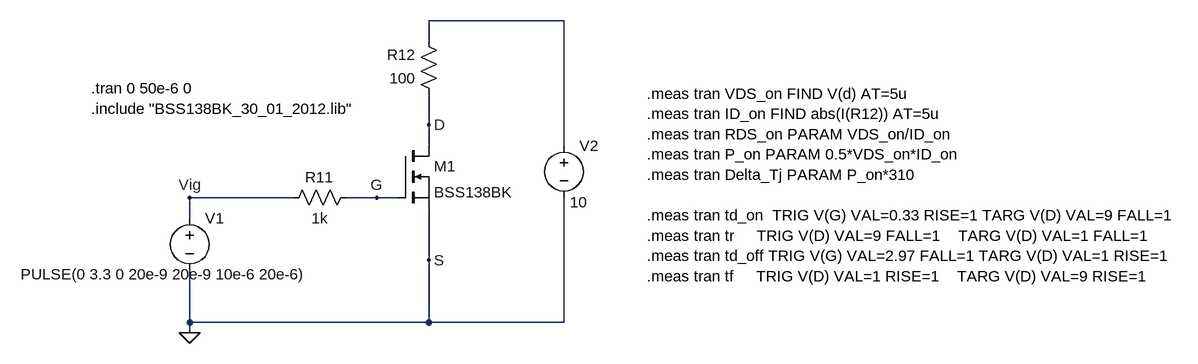
[diagram p0: schematic simulation.asc]
simulation.asc, the LTspice schematic file:
Version 4.1
SHEET 1 1452 680
WIRE 464 -112 256 -112
WIRE 256 -80 256 -112
WIRE 256 48 256 0
WIRE 256 80 256 48
WIRE 464 80 464 -112
WIRE 48 160 -112 160
WIRE 176 160 128 160
WIRE 208 160 176 160
WIRE -112 192 -112 160
WIRE 256 256 256 176
WIRE -112 352 -112 272
WIRE 256 352 256 256
WIRE 256 352 -112 352
WIRE 464 352 464 160
WIRE 464 352 256 352
WIRE -112 368 -112 352
FLAG -112 368 0
FLAG -112 160 Vig
FLAG 176 160 G
FLAG 256 256 S
FLAG 256 48 D
SYMBOL res 144 144 R90
WINDOW 0 0 56 VBottom 2
WINDOW 3 32 56 VTop 2
SYMATTR InstName R11
SYMATTR Value 1k
SYMBOL res 272 16 R180
WINDOW 0 36 76 Left 2
WINDOW 3 36 40 Left 2
SYMATTR InstName R12
SYMATTR Value 100
SYMBOL voltage -112 176 R0
WINDOW 3 -260 102 Left 2
WINDOW 123 0 0 Left 0
WINDOW 39 0 0 Left 0
SYMATTR InstName V1
SYMATTR Value PULSE(0 3.3 0 20e-9 20e-9 10e-6 20e-6)
SYMBOL voltage 464 64 R0
WINDOW 3 9 103 Left 2
WINDOW 123 0 0 Left 0
WINDOW 39 0 0 Left 0
SYMATTR InstName V2
SYMATTR Value 10
SYMBOL nmos 208 80 R0
SYMATTR InstName M1
SYMATTR Value BSS138BK
SYMATTR Prefix x
TEXT -264 -8 Left 2 !.tran 0 50e-6 0\n.include "BSS138BK_30_01_2012.lib"
TEXT 592 0 Left 2 !.meas tran VDS_on FIND V(d) AT=5u\n.meas tran ID_on FIND abs(I(R12)) AT=5u\n.meas tran RDS_on PARAM VDS_on/ID_on\n.meas tran P_on PARAM 0.5*VDS_on*ID_on\n.meas tran Delta_Tj PARAM P_on*310\n \n.meas tran td_on  TRIG V(G) VAL=0.33 RISE=1 TARG V(D) VAL=9 FALL=1\n.meas tran tr     TRIG V(D) VAL=9 FALL=1    TARG V(D) VAL=1 FALL=1\n.meas tran td_off TRIG V(G) VAL=2.97 FALL=1 TARG V(D) VAL=1 RISE=1\n.meas tran tf     TRIG V(D) VAL=1 RISE=1    TARG V(D) VAL=9 RISE=1

The netlist it stands for:
* simulation.asc
R11 G Vig 1k
R12 D N001 100
V1 Vig 0 PULSE(0 3.3 0 20e-9 20e-9 10e-6 20e-6)
V2 N001 0 10
X§M1 D G 0 BSS138BK  ; pins D G S
.tran 0 50e-6 0
.include "BSS138BK_30_01_2012.lib"
.meas tran VDS_on FIND V(d) AT=5u
.meas tran ID_on FIND abs(I(R12)) AT=5u
.meas tran RDS_on PARAM VDS_on/ID_on
.meas tran P_on PARAM 0.5*VDS_on*ID_on
.meas tran Delta_Tj PARAM P_on*310
.meas tran td_on  TRIG V(G) VAL=0.33 RISE=1 TARG V(D) VAL=9 FALL=1
.meas tran tr     TRIG V(D) VAL=9 FALL=1    TARG V(D) VAL=1 FALL=1
.meas tran td_off TRIG V(G) VAL=2.97 FALL=1 TARG V(D) VAL=1 RISE=1
.meas tran tf     TRIG V(D) VAL=1 RISE=1    TARG V(D) VAL=9 RISE=1
.backanno
.end

* Results of the author's LTspice run, read from the files saved beside the schematic
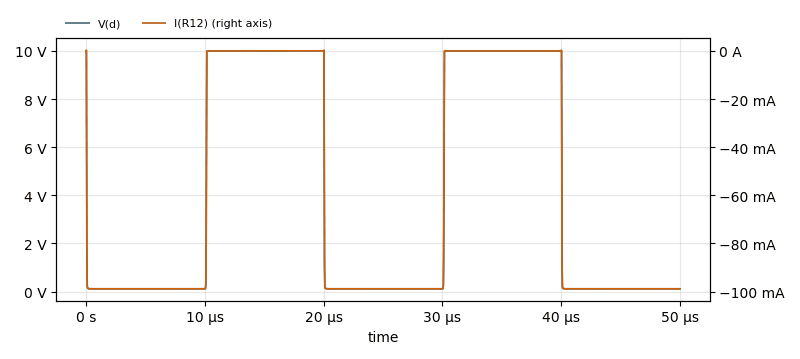
[diagram p1: Transient Analysis of simulation.asc, plotted from the saved traces]
* Transient Analysis, 1 run:
*   V(d): min 117.2 mV, max 10.02 V, average 4.05 V, rms 6.301 V, last 117.3 mV
*   I(R12): min -98.83 mA, max 223.5 µA, average -59.5 mA, rms 76.62 mA, last -98.83 mA
* From the log:
*   vds_on: V(d) =0.117355212543 at 5e-06
*   id_on: abs(I(R12)) =0.0988264482514 at 5e-06
*   rds_on: VDS_on/ID_on=1.18748791057
*   p_on: 0.5*VDS_on*ID_on=0.00579889941972
*   delta_tj: P_on*310=1.79765882011
*   td_on=2.10657187299e-08 FROM 1.32906956951e-08 TO 3.4356414425e-08
*   tr=4.4416282111e-08 FROM 3.4356414425e-08 TO 7.87726965361e-08
*   td_off=6.2280064375e-08 FROM 1.00362465969e-05 TO 1.00985266612e-05
*   tf=5.50374480888e-08 FROM 1.00985266612e-05 TO 1.01535641093e-05